# Altium schematic sheet Single_ETU_sht2.SchDoc
size B; PageSetup: Record=PageOptions|CenterHorizontal=True|CenterVertical=True|PrintScale=1.12|XCorrection=1.00|YCorrection=1.00|PrintKind=1|BorderSize=5000000|LeftOffset=0|BottomOffset=0|Orientation=2|PaperLength=1000|PaperWidth=1000|Scale=100|PaperSource=15|PrintQuality=1200|MediaType=1|DitherType=10|PrintScaleMode=1|PaperKind=Tabloid|PaperIndex=3
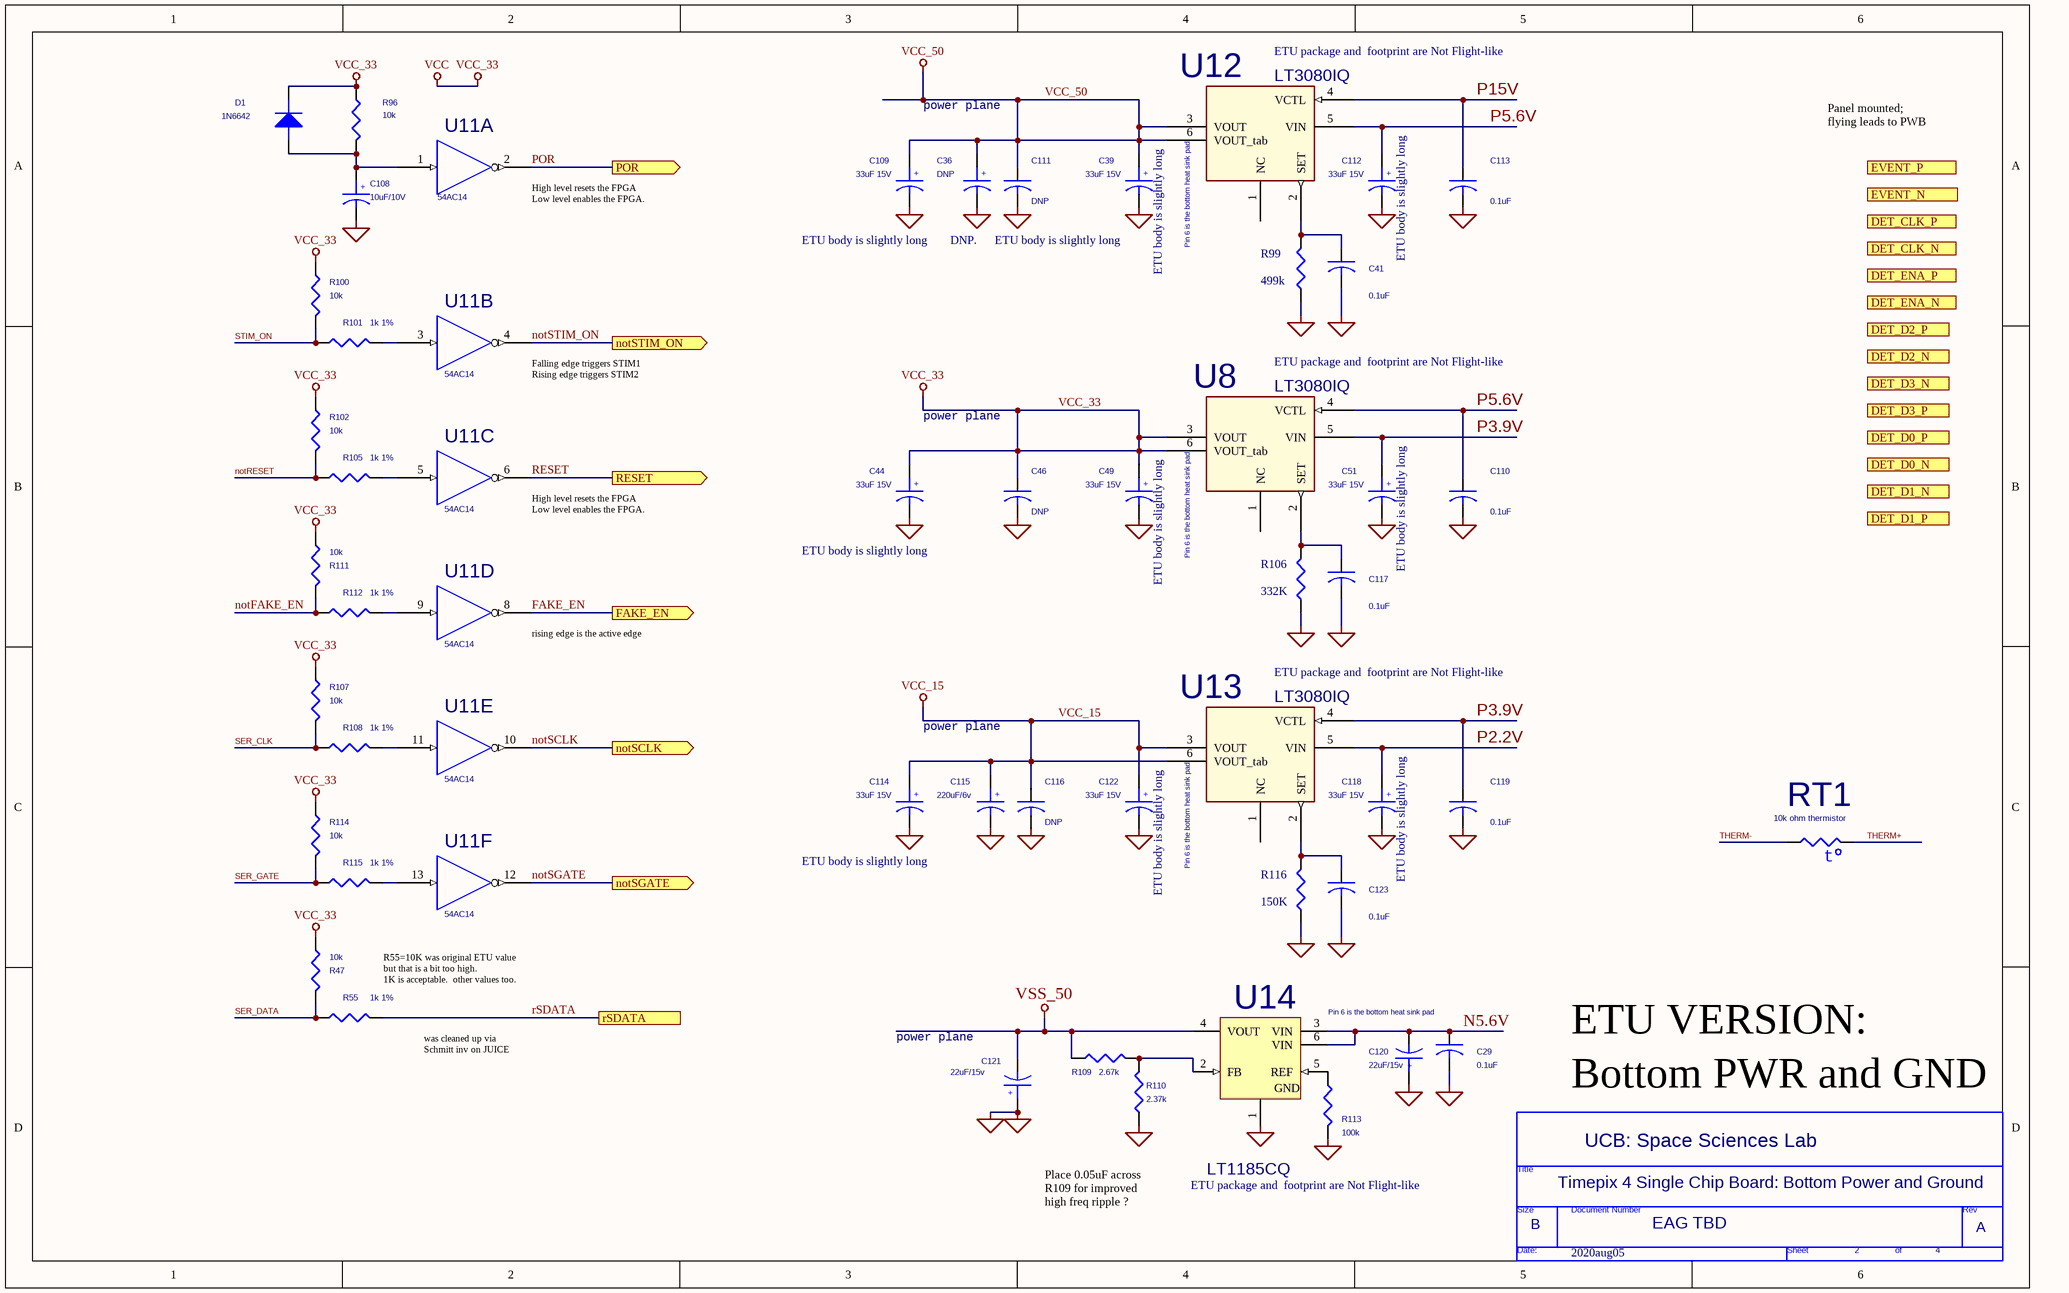
[diagram p0: Single_ETU_sht2.SchDoc]

## Parts
*  Page Create Date: 2020aug05  RevCode: A  Title: Timepix 4 Single Chip Board: Bottom Power and Ground  OrgName: UCB: Space Sciences Lab  Page Size: B  Page Number: 2  Page Count: 4  Document: EAG TBD  (hidden comment: TitleBlock2)  (graphical)
C29  0.1uF  [6-0805_M]
C36  DNP  Assembly comment: DNP.      ETU body is slightly long  [CAP_POL_2611]
C39  33uF 15V  Assembly comment: ETU body is slightly long  [CAP_POL_2611]
C41  0.1uF  [6-0805_M]
C44  33uF 15V  Assembly comment: ETU body is slightly long  [CAP_POL_2611]
C46  DNP  [6-0805_M]
C49  33uF 15V  Assembly comment: ETU body is slightly long  [CAP_POL_2611]
C51  33uF 15V  Assembly comment: ETU body is slightly long  [CAP_POL_2611]
C108  10uF/10V  [CAP_POL_2005]
C109  33uF 15V  Assembly comment: ETU body is slightly long  [CAP_POL_2611]
C110  0.1uF  [6-0805_M]
C111  DNP  [6-0805_M]
C112  33uF 15V  Assembly comment: ETU body is slightly long  [CAP_POL_2611]
C113  0.1uF  [6-0805_M]
C114  33uF 15V  Assembly comment: ETU body is slightly long  [CAP_POL_2611]
C115  220uF/6v  [CAP_POL_2915]
C116  DNP  [6-0805_M]
C117  0.1uF  [6-0805_M]
C118  33uF 15V  Assembly comment: ETU body is slightly long  [CAP_POL_2611]
C119  0.1uF  [6-0805_M]
C120  22uF/15v  [CAP_POL_2611]
C121  22uF/15v  [CAP_POL_2611]
C122  33uF 15V  Assembly comment: ETU body is slightly long  [CAP_POL_2611]
C123  0.1uF  [6-0805_M]
D1  1N6642  [DIOMELF4620M]
R47  10k  [1608[0603]]
R55  1k 1%  [1608[0603]]
R96  10k  [1608[0603]]
R99  499k  [J1-0603]
R100  10k  [1608[0603]]
R101  1k 1%  [1608[0603]]
R102  10k  [1608[0603]]
R105  1k 1%  [1608[0603]]
R106  332K  [J1-0603]
R107  10k  [1608[0603]]
R108  1k 1%  [1608[0603]]
R109  2.67k  [1608[0603]]
R110  2.37k  [1608[0603]]
R111  10k  [1608[0603]]
R112  1k 1%  [1608[0603]]
R113  100k  [1608[0603]]
R114  10k  [1608[0603]]
R115  1k 1%  [1608[0603]]
R116  150K  [J1-0603]
RT1  10k ohm thermistor  [thermistor2]
U8  LT3080IQ  Assembly comment: ETU package and  footprint are Not Flight-like  [DDPAK_5PIN]
U11  54AC14  [SO-14_M]  (parts A,B,C,D,E,F of 6)
U12  LT3080IQ  Assembly comment: ETU package and  footprint are Not Flight-like  [DDPAK_5PIN]
U13  LT3080IQ  Assembly comment: ETU package and  footprint are Not Flight-like  [DDPAK_5PIN]
U14  LT1185CQ  Assembly comment: ETU package and  footprint are Not Flight-like  [DDPAK_5PIN]

## Ports
DET_CLK_N, DET_CLK_P, DET_D0_N, DET_D0_P, DET_D1_N, DET_D1_P, DET_D2_N, DET_D2_P, DET_D3_N, DET_D3_P, DET_ENA_N, DET_ENA_P, EVENT_N, EVENT_P (in), FAKE_EN (out), notSCLK (out), notSGATE (out), notSTIM_ON (out), POR (out), RESET (out), rSDATA

## Nets
GND: C29.2 C36.2 C39.2 C41.2 C44.2 C46.2 C49.2 C51.2 C108.2 C109.2 C110.2 C111.2 C112.2 C113.2 C114.2 C115.2 C116.2 C117.2 C118.2 C119.2 C120.1 C121.1 C122.2 C123.2 R99.1 R106.1 R110.1 R113.2 R116.1 U11.7(GND) U14.1(GND)  [also labelled GND SIGNAL]
VCC_15: C114.1 C115.1 C116.1 C122.1 U13.3(VOUT) U13.6(VOUT_tab)
VCC_33: C44.1 C46.1 C49.1 D1.CATHODE R47.2 R96.1 R100.2 R102.2 R107.2 R111.2 R114.2 U8.3(VOUT) U8.6(VOUT_tab) U11.14(VCC)  [also labelled VCC]
VCC_50: C36.1 C39.1 C109.1 C111.1 U12.3(VOUT) U12.6(VOUT_tab)
VSS_50: C121.2 R109.1 U14.4(VOUT)
FAKE_EN: U11.8(O) ; port FAKE_EN
N5.6V: C29.1 C120.2 U14.3(VIN) U14.6(VIN)
notFAKE_EN: R111.1 R112.1
notRESET: R102.1 R105.1
notSCLK: U11.10(O) ; port notSCLK
notSGATE: U11.12(O) ; port notSGATE
notSTIM_ON: U11.4(O) ; port notSTIM_ON
P2.2V: C118.1 U13.5(VIN)
P3.9V: C51.1 C119.1 U8.5(VIN) U13.4(VCTL)
P5.6V: C110.1 C112.1 U8.4(VCTL) U12.5(VIN)
P15V: C113.1 U12.4(VCTL)
POR: U11.2(O) ; port POR
RESET: U11.6(O) ; port RESET
rSDATA: R55.2 ; port rSDATA
SER_CLK: R107.1 R108.1
SER_DATA: R47.1 R55.1
SER_GATE: R114.1 R115.1
STIM_ON: R100.1 R101.1
THERM+: RT1.2
THERM-: RT1.1
NetC41_1: C41.1 R99.2 U12.2(SET)
NetC108_1: C108.1 D1.ANODE R96.2 U11.1(I)
NetC117_1: C117.1 R106.2 U8.2(SET)
NetC123_1: C123.1 R116.2 U13.2(SET)
NetR101_2: R101.2 U11.3(I)
NetR105_2: R105.2 U11.5(I)
NetR108_2: R108.2 U11.11(I)
NetR109_2: R109.2 R110.2 U14.2(FB)
NetR112_2: R112.2 U11.9(I)
NetR113_1: R113.1 U14.5(REF)
NetR115_2: R115.2 U11.13(I)

Not connected (* = marked no-connect by the designer): U8 1(NC); U12 1(NC); U13 1(NC)

## Notes on the sheet
- power plane
- Panel mounted;
  flying leads to PWB
- (near U11) High level resets the FPGA
  Low level enables the FPGA.
- (near U12) Pin 6 is the bottom heat sink pad
- (near U11) Falling edge triggers STIM1
  Rising edge triggers STIM2
- (near U8) Pin 6 is the bottom heat sink pad
- (near U11) rising edge is the active edge
- (near U13) Pin 6 is the bottom heat sink pad
- (near R55) R55=10K was original ETU value
  but that is a bit too high.
  1K is acceptable.  other values too.
- Pin 6 is the bottom heat sink pad
- ETU VERSION:
- was cleaned up via
  Schmitt inv on JUICE
- Bottom PWR and GND
- Place 0.05uF across
  R109 for improved
  high freq ripple ?
- (in symbol CAPACITOR POL) +
- (in symbol THERMISTOR 2) t
- (in symbol TitleBlock2) Title; Size; Document Number; Rev; Date:; Sheet; of

## Library data of the parts
* = TitleBlock2: OrgAddr3: MRD
C29 C41 C110 C113 C117 C119 C123 = C: 0.1uF 50V 10% X7R 0805 ceramic cap; ETU_vendor: Digikey; ETU_manf: Yageo; ETU_PN_PO: 311-1361-1-ND; ETU_PN: CC0805ZRY5V9BB104; PN: G311P829AEX104K2N; manf: Presidio Components; vendor: TBD; item: 3a; Min PO QTY: 306; PN_PO: G311P829AEX104K2N; manf_ds: http://www.presidiocomponents.com/products/S-311-P-829G.pdf; manf_url: http://www.presidiocomponents.com/products/Space-Military-Ceramic-Capacitors-Links.html; ETU_manf_ds: http://www.yageo.com/documents/recent/UPY-GPHC_Y5V_6.3V-to-50V_6.pdf; ETU_manf_url: http://www.yageo.com/NewPortal/_en/search/search-1-1.jsp; package: C0805
C36 = CAPACITOR POL: Tantalum 33uF 15V 10% 0.8ohm @ 100 KHz ESR, Size F (0.220 x 0.135 x 0.070), 0.35A ripple @ 100 kHz, Weibull B reliability, 10 cycle surge test, hot solder dipped; ETU_PN_PO: 80-T491C336K016; ETU_PN: T491C336K016AT; PN: CWR29HC336KCFB; ESR: 0.8 ohms; ETU_ESR: 1.2 ohms; manf: AVX; ETU_manf: Kemet; ETU_vendor: Mouser; vendor: TBD; item: 7a; Min PO QTY: 10; PN_PO: CWR29HC336KCFB; ETU_manf_ds: http://www.kemet.com/Lists/ProductCatalog/Attachments/254/KEM_T2005_T491.pdf; manf_ds: http://datasheets.avx.com/CWR09-29.pdf; manf_url: http://www.avx.com/products/tantalum/high-reliability/space-level/cwr091929-mil-prf-55365/; ETU_manf_url: http://www.kemet.com/Tantalum-MnO2; package: CWR29_F
C39 C44 C49 C51 C109 C112 C114 C118 C122 = CAPACITOR POL: Tantalum 33uF 15V 10% 0.8ohm @ 100 KHz ESR, Size F (0.220 x 0.135 x 0.070), 0.35A ripple @ 100 kHz, Weibull B reliability, 10 cycle surge test, hot solder dipped; ETU_PN_PO: 80-T491C336K016; ETU_PN: T491C336K016AT; PN: CWR29HC336KCFB; ESR: 0.8 ohms; ETU_ESR: 1.2 ohms; ETU_vendor: Mouser; vendor: TBD; ETU_manf: Kemet; manf: AVX; manf_url: 'http://www.kemet.com/Tantalum-MnO2; item: 7b; Min PO QTY: 54; PN_PO: CWR29HC336KCFB; manf_ds: http://datasheets.avx.com/CWR09-29.pdf; manf_url: http://www.avx.com/products/tantalum/high-reliability/space-level/cwr091929-mil-prf-55365/; ETU_manf_ds: http://www.kemet.com/Lists/ProductCatalog/Attachments/254/KEM_T2005_T491.pdf; ETU_manf_url: http://www.kemet.com/Tantalum-MnO2; package: CWR29_F
C46 C111 C116 = C: 0.1uF 50V 10% X7R 0805 ceramic cap; ETU_PN: CC0805ZRY5V9BB104; vendor: Presidio Components; PN: G311P829AEX104K2N; ETU_manf: Yageo; ETU_PN_PO: 603-CC805ZRY5V9BB104; ETU_vendor: Mouser; Assembly comment: DNP; item: 3b; Min PO QTY: 20; manf: Presidio Components; PN_PO: G311P829AEX104K2N; manf_ds: http://www.presidiocomponents.com/products/S-311-P-829G.pdf; manf_url: http://www.presidiocomponents.com/products/Space-Military-Ceramic-Capacitors-Links.html; ETU_manf_ds: http://www.yageo.com/documents/recent/UPY-GPHC_Y5V_6.3V-to-50V_6.pdf; ETU_manf_url: http://www.yageo.com/NewPortal/_en/search/search-1-1.jsp; package: C0805
C108 = CAPACITOR POL: Tantalum 10uF 10V 10% 1.3ohm @ 100 KHz ESR, Size D (0.150 x 0.100 x 0.050), 0.25A ripple @ 100 kHz, Weibull B reliability, 10 cycle surge test, hot solder dipped; ETU_PN: T491A106K010AT; ETU_PN_PO: 399-3684-1-ND; ETU_vendor: Digikey; vendor: TBD; PN: CWR29FC106KCDB; manf: AVX; ETU_manf: Kemet; item: 2; Min PO QTY: 108; PN_PO: CWR29FC106KCDB; ETU_manf_ds: http://www.kemet.com/Lists/ProductCatalog/Attachments/254/KEM_T2005_T491.pdf; manf_ds: http://datasheets.avx.com/CWR09-29.pdf; manf_url: http://www.avx.com/products/tantalum/high-reliability/space-level/cwr091929-mil-prf-55365/; ETU_manf_url: http://www.kemet.com/Tantalum-MnO2; package: CWR29_D
C115 = CAPACITOR POL: Tantalum 220uF 6V 10% 0.18ohm @ 100 KHz ESR, Size H (0.285 x 0.150 x 0.110), 0.91A ripple @ 100 kHz, Weibull B reliability, 10 cycle surge test, hot solder dipped; ETU_PN: T495C227K006ATE225; ETU_PN_PO: 399-3877-1-ND; ETU_manf: Kemet; vendor: TBD; PN: CWR29DC227KCHB; ETU_vendor: Digikey; manf: AVX; item: 10; Min PO QTY: 15; manf_ds: http://datasheets.avx.com/CWR09-29.pdf; manf_url: http://www.avx.com/products/tantalum/high-reliability/space-level/cwr091929-mil-prf-55365/; ETU_manf_ds: http://www.kemet.com/Lists/ProductCatalog/Attachments/254/KEM_T2005_T491.pdf; ETU_manf_url: http://www.kemet.com/Tantalum-MnO2; PN_PO: CWR29DC227KCHB; package: CWR29_H
C120 C121 = CAPACITOR POL: Tantalum 22uF 15V 10% 0.8ohm @ 100 KHz ESR, Size F (0.220 x 0.135 x 0.070), 0.35A ripple @ 100 kHz, Weibull B reliability, 10 cycle surge test, hot solder dipped; ETU_PN: T495C226K025ATE300; PN: CWR29HC226KCFB; ETU_PN_PO: 399-8491-1-ND; ETU_vendor: Digikey; ETU_manf: Kemet; vendor: TBD; manf: AVX; item: 12; Min PO QTY: 15; ETU_manf_ds: http://www.kemet.com/Lists/ProductCatalog/Attachments/254/KEM_T2005_T491.pdf; ETU_manf_url: http://www.kemet.com/Tantalum-MnO2; manf_url: http://www.avx.com/products/tantalum/high-reliability/space-level/cwr091929-mil-prf-55365/; manf_ds: http://datasheets.avx.com/CWR09-29.pdf; PN_PO: CWR29HC226KCFB; package: CWR29_F
D1 = D: Small signal switching diode 100V 300mA (for reset circuit); ETU_PN_PO: 1N4148WTPMSCT-ND; ETU_PN: 1N4148W-TP; ETU_manf: Micro Commercial Components; manf: Microsemi; vendor: TBD; ETU_vendor: Digikey; PN: JANTXV1N6642US; item: 13; Min PO QTY: 10; ETU_manf_ds: http://www.mccsemi.com/up_pdf/1N4148W(SOD123).pdf; ETU_manf_url: http://www.mccsemi.com/SearchDiodes.aspx?cid=103; manf_url: http://www.microsemi.com/existing-parts/parts/58901; manf_ds: http://www.microsemi.com/index.php?option=com_docman&task=doc_download&gid=5895; PN_PO: JANTXV1N6642US; package: SM_D-5D
R47 R96 R100 R102 R107 R111 R114 = R: 10k ohm 1/10W 50V 1% +/- 25 PPM thin film resistor. 0603.; ETU_PN: CRCW060310K0FKEA; ETU_vendor: Mouser; Assembly comment: ETU part is Not 25 PPM.v  Mouser PN_PO gets translated to : 71-CRCW0603-10K-E3; ETU_manf: Vishay Dale; manf: State of the Art; PN: M55342E12B10E0R; ETU_PN_PO: 541-10.0-KHCT-ND; item: 19; Min PO QTY: 150; ETU_manf_ds: http://www.vishay.com/docs/20035/dcrcwe3.pdf; ETU_manf_url: http://www.vishay.com/resistors-fixed/list/product-20035/; manf_ds: http://www.resistor.com/assets/pdf/12milthn.pdf; manf_url: http://www.resistor.com/pthin_mil.htm; vendor: State of the Art; PN_PO: M55342E12B10E0R; package: RM0603
R55 R101 R105 R108 R115 = R: 1k ohm 1/10W 50V 1% +/- 25 PPM thin film resistor. 0603.; ETU_PN: CRCW06031K00FKEA; ETU_vendor: Digikey; Assembly comment: Decrease from 10k to support ~ faster edge rates, and common loading on LASP sources.; ETU_manf: Vishay Dale; manf: State of the Art; PN: M55342K12B1E00R; ETU_PN_PO: 541-1.00KHCT-ND; item: 23b; Min PO QTY: 36; ETU_manf_ds: http://www.vishay.com/docs/20035/dcrcwe3.pdf; ETU_manf_url: http://www.vishay.com/resistors-fixed/list/product-20035/; manf_ds: http://www.resistor.com/assets/pdf/12mil.pdf; manf_url: http://www.resistor.com/pthick_mil.htm; vendor: State of the Art; PN_PO: M55342K12B1E00R; package: RM0603
R99 = Res3: 499k ohm 1/10W 50V 1% +/- 100 PPM thick film resistor. 0603.; ETU_PN: CRCW0603499KFKEA; ETU_PN_PO: 71-CRCW0603-499K-E3; ETU_manf: Vishay Dale; ETU_vendor: Mouser; vendor: State of the Art; PN: M55342K12B499ER; item: 40; Min PO QTY: 10; manf: State of the Art; PN_PO: M55342K12B499ER; package: RM0603; manf_ds: http://www.resistor.com/assets/pdf/12mil.pdf; manf_url: http://www.resistor.com/pthick_mil.htm; ETU_manf_ds: http://www.vishay.com/docs/20035/dcrcwe3.pdf; ETU_manf_url: http://www.vishay.com/resistors-fixed/list/product-20035/
R106 = Res3: 332k ohm 1/10W 50V 1% +/- 100 PPM thick film resistor. 0603.; ETU_PN_PO: 71-CRCW0603-330K-E3; ETU_PN: CRCW0603330KFKEA; Assembly comment: Is near U8 pin 2.; vendor: State of the Art; PN: M55342K12B332ER; ETU_vendor: Mouser; ETU_manf: Vishay Dale; item: 41; Min PO QTY: 10; manf: State of the Art; PN_PO: M55342K12B332ER; package: RM0603; manf_ds: http://www.resistor.com/assets/pdf/12mil.pdf; manf_url: http://www.resistor.com/pthick_mil.htm; ETU_manf_ds: http://www.vishay.com/docs/20035/dcrcwe3.pdf; ETU_manf_url: http://www.vishay.com/resistors-fixed/list/product-20035/
R109 = R: 2.67k ohm 1/10W 50V 1% +/- 100 PPM thick film resistor. 0603.; ETU_PN: CRCW06032K67FKEA; ETU_vendor: Digikey; ETU_manf: Vishay Dale; manf: State of the Art; PN: M55342K12B2E67R; ETU_PN_PO: 541-2.67KHCT-ND; item: 42; Min PO QTY: 10; ETU_manf_ds: http://www.vishay.com/docs/20035/dcrcwe3.pdf; ETU_manf_url: http://www.vishay.com/resistors-fixed/list/product-20035/; manf_ds: http://www.resistor.com/assets/pdf/12mil.pdf; manf_url: http://www.resistor.com/pthick_mil.htm; vendor: State of the Art; PN_PO: M55342K12B2E67R; package: RM0603
R110 = R: 2.37k ohm 1/10W 50V 1% +/- 100 PPM thick film resistor. 0603.; ETU_PN: CRCW06032K37FKEA; ETU_vendor: Digikey; ETU_manf: Vishay Dale; manf: State of the Art; PN: M55342K12B2E37R; ETU_PN_PO: 541-2.37KHCT-ND; item: 43; Min PO QTY: 10; ETU_manf_ds: http://www.vishay.com/docs/20035/dcrcwe3.pdf; ETU_manf_url: http://www.vishay.com/resistors-fixed/list/product-20035/; manf_ds: http://www.resistor.com/assets/pdf/12mil.pdf; manf_url: http://www.resistor.com/pthick_mil.htm; vendor: State of the Art; PN_PO: M55342K12B2E37R; package: RM0603
R112 = R: 1k ohm 1/10W 50V 1% +/- 100 PPM thick film resistor. 0603.; ETU_PN: CRCW06031K00FKEA; ETU_vendor: Digikey; Assembly comment: Decrease from 10k to support ~ faster edge rates, and common loading on LASP sources.; ETU_manf: Vishay Dale; manf: State of the Art; PN: M55342K12B1E00R; ETU_PN_PO: 541-1.00KHCT-ND; item: 23b; Min PO QTY: 36; ETU_manf_ds: http://www.vishay.com/docs/20035/dcrcwe3.pdf; ETU_manf_url: http://www.vishay.com/resistors-fixed/list/product-20035/; manf_ds: http://www.resistor.com/assets/pdf/12mil.pdf; manf_url: http://www.resistor.com/pthick_mil.htm; vendor: State of the Art; PN_PO: M55342K12B1E00R; package: RM0603
R113 = R: 100k ohm 1/10W 50V 1% +/- 100 PPM thick film resistor. 0603.; ETU_PN: CRCW0603100KFKEA; ETU_vendor: Mouser; ETU_manf: Vishay Dale; manf: State of the Art; PN: M55342K12B100ER; ETU_PN_PO: 71-CRCW0603-100K-E3; item: 38; Min PO QTY: 20; ETU_manf_ds: http://www.vishay.com/docs/20035/dcrcwe3.pdf; ETU_manf_url: http://www.vishay.com/resistors-fixed/list/product-20035/; manf_ds: http://www.resistor.com/assets/pdf/12mil.pdf; manf_url: http://www.resistor.com/pthick_mil.htm; vendor: State of the Art; PN_PO: M55342K12B100ER; package: RM0603
R116 = Res3: 150k ohm 1/10W 50V 1% +/- 100 PPM thick film resistor. 0603.; ETU_PN_PO: 71-CRCW0603-150K-E3; Assembly comment: Is near U13 pin 2. ETU silkscreen has "R106"; ETU_PN: CRCW0603150KFKEA; ETU_manf: Vishay Dale; PN: M55342K12B150ER; manf: State of the Art; ETU_vendor: Mouser; item: 44; Min PO QTY: 10; PN_PO: M55342K12B150ER; vendor: State of the Art; package: RM0603; manf_ds: http://www.resistor.com/assets/pdf/12mil.pdf; manf_url: http://www.resistor.com/pthick_mil.htm; ETU_manf_ds: http://www.vishay.com/docs/20035/dcrcwe3.pdf; ETU_manf_url: http://www.vishay.com/resistors-fixed/list/product-20035/
RT1 = THERMISTOR 2: 10k ohm 0.1degC 0 to 70degC 7.6cm long 32AWG copper leads 0.1" radial thru hole NTC thermistor; ETU_PN_PO: 824-701031; ETU_PN: 701031; PN: 311P18-08S7R6; ETU_vendor: Mouser; vendor: Measurement Specialties; Assembly comment: is coupled to the PWB near 1 of the ADCs; item: 45; Min PO QTY: 10; PN_PO: 311P18-08S7R6; manf_ds: http://meas-spec.com/downloads/44908.pdf; ETU_manf_ds: http://meas-spec.com/downloads/44031.pdf; manf: Measurement Specialties; ETU_manf: Measurement Specialties; manf_url: http://meas-spec.com/product/temperature/44900.aspx; ETU_manf_url: http://meas-spec.com/product/t_product.aspx?id=5409; package: TH_Radial
U8 U12 U13 = LT3080IQ: 0.5V dropout for 0.7A positive adjustable Vout LDO regulator. CERFP-10 gullwing; manf: MS Kennedy; ETU_manf: Linear Technology; ETU_PN: LT3080IQ#PBF; ETU_PN_PO: LT3080IQ#PBF-ND; ETU_vendor: Digikey; PN: MSK5978VRHG; item: 51; Min PO QTY: 0; vendor: MS Kennedy; manf_url: http://www.mskennedy.com/products/Linear-Regulators/MSK5978RH.prod; manf_ds: http://www.mskennedy.com/sites/default/files/5978RHrk.pdf; package: CERFP-10 gullwing; ETU_manf_ds: http://cds.linear.com/docs/en/datasheet/3080fc.pdf; ETU_manf_url: http://www.linear.com/product/LT3080; PN_PO: MSK5978VRHG
U11 = 74AC14: Hex CMOS Schmitt trigger inverter.  CDFP3-F14; ETU_PN: CD74AC14M96; ETU_PN_PO: 296-1981-1-ND; ETU_manf: Texas Instruments; ETU_vendor: Digikey; Assembly comment: ETU part and footprint are not Flight-like.; Alt_manf: Cobham (Aeroflex); PN: RHFAC14K02V; PN_PO: 5962F8762401VXA; Alt_PN_PO: 5962H9652402VXA; Alt_PN: UT54ACS14EUVAH; manf: ST Microelectronics; item: 53; Min PO QTY: 0; ETU_manf_ds: http://www.ti.com/lit/ds/symlink/cd74ac14.pdf; ETU_manf_url: http://www.ti.com/product/cd74ac14?keyMatch=CD74AC14; package: CERFP-14; Alt_manf_ds: http://ams.aeroflex.com/pagesproduct/datasheets/msi/msimanual/acts14.pdf; Alt_manf_url: http://ams.aeroflex.com/pagesproduct/prods-hirel-msilogic.cfm; Alt_vendor: Cobham (Aeroflex); manf_url: http://www.st.com/content/st_com/en/products/aerospace-and-defense-products/space-products/rad-hard-logic-ics/rad-hard-54-ac-act-series/54ac14.html; Alt_manf_ds_dla: http://www.landandmaritime.dla.mil/Downloads/MilSpec/Smd/96524.pdf; manf_ds_dla: http://www.landandmaritime.dla.mil/Downloads/MilSpec/Smd/87624.pdf; manf_ds: http://www.st.com/content/ccc/resource/technical/document/data_brief/b7/7f/50/e7/00/1a/44/1e/CD00269766.pdf/files/CD00269766.pdf/jcr:content/translations/en.CD00269766.pdf; vendor: ST Microelectronics
U14 = LT1185CQ: 1.05V dropout for 3A, negative adjustable Vout LDO regulator, SMD-0.5-3; ETU_vendor: Digi-Key; ETU_manf: Linear Technology; ETU_PN_PO: LT1185CQ#PBF-ND; manf: Cobham (Aeroflex); PN: VRG8663-901-1S; PN_PO: 5962R0920702KYC; item: 54; Min PO QTY: 0; ETU_PN: LT1185CQ; ETU_manf_ds: http://cds.linear.com/docs/en/datasheet/1185ff.pdf; ETU_manf_url: http://www.linear.com/product/LT1185; manf_url: http://ams.aeroflex.com/pagesproduct/prods-hirel-voltage.cfm; manf_ds: http://ams.aeroflex.com/pagesproduct/datasheets/vrg/VRG8663.pdf; package: SMD-0.5-3; vendor: Cobham (Aeroflex); manf_ds_dla: http://www.landandmaritime.dla.mil/Downloads/MilSpec/Smd/09207.pdf